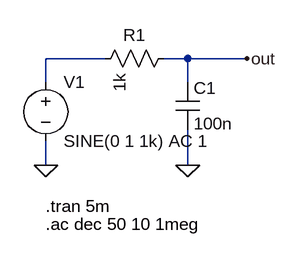
[diagram p0: schematic rc_lowpass.asc]
rc_lowpass.asc, the LTspice schematic file:
Version 4
SHEET 1 880 680
WIRE 112 96 32 96
WIRE 224 96 192 96
WIRE 304 96 224 96
WIRE 32 128 32 96
WIRE 224 128 224 96
WIRE 32 240 32 208
WIRE 224 240 224 192
FLAG 32 240 0
FLAG 224 240 0
FLAG 304 96 out
SYMBOL voltage 32 112 R0
SYMATTR InstName V1
SYMATTR Value SINE(0 1 1k) AC 1
SYMBOL res 208 80 R90
WINDOW 0 0 56 VBottom 2
SYMATTR InstName R1
SYMATTR Value 1k
SYMBOL cap 208 128 R0
SYMATTR InstName C1
SYMATTR Value 100n
TEXT 32 296 Left 2 !.tran 5m
TEXT 32 320 Left 2 !.ac dec 50 10 1meg

The netlist it stands for:
* rc_lowpass.asc
V1 N001 0 SINE(0 1 1k) AC 1
R1 out N001 1k
C1 out 0 100n
.tran 5m
.ac dec 50 10 1meg
.backanno
.end